# EasyEDA Pro project ProPrj_信号发生器_2025-05-10.epro

# Schematic Schematic1
Board Name: Board1; Create Date: 2025-05-10; Page Name: P1; Project Name: 信号发生器; Schematic Name: Schematic1; Update Date: 2025-05-10; Company: 嘉立创EDA; Page Size: A3; Version: V1.0
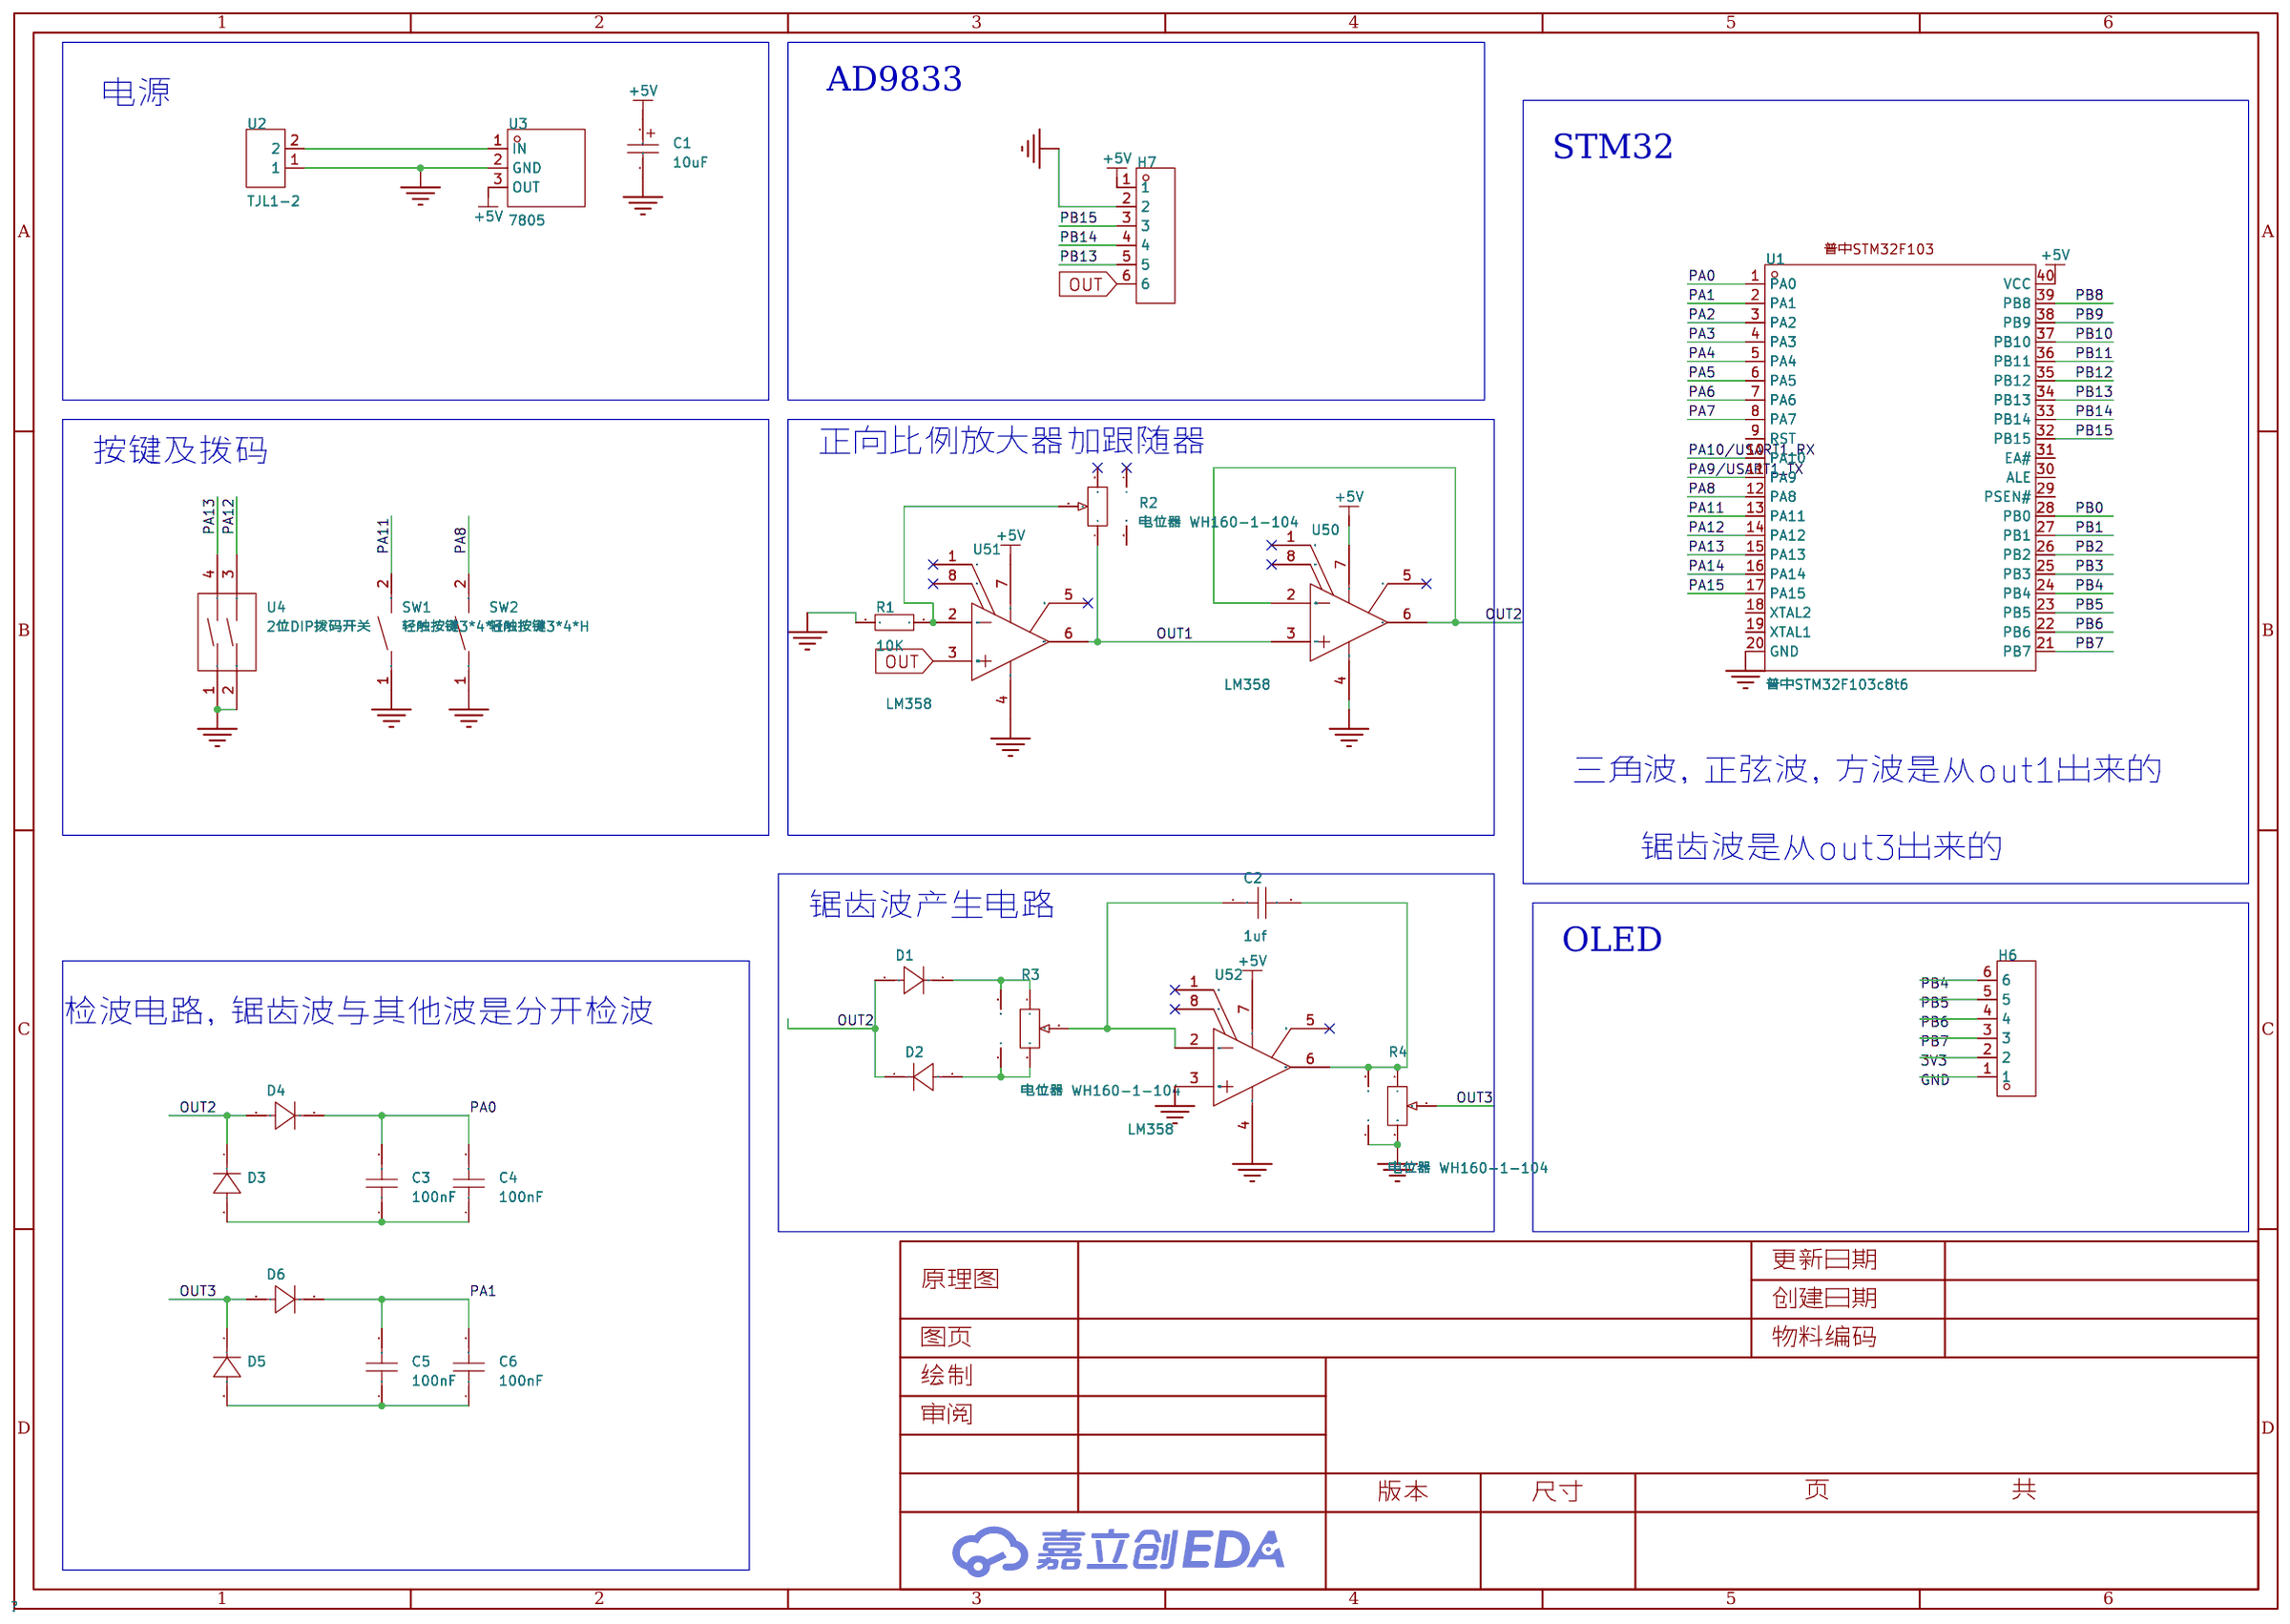
[diagram p0: schematic sheet]

## Parts
C1  10uF  [C_Ele_SMD_3x5.4mm]
C2  1uf  [C0603]
C3  100nF  [C0603]
C4  100nF  [C0603]
C5  100nF  [C0603]
C6  100nF  [C0603]
D1  -  [DO_1N4007]
D2  -  [DO_1N4007]
D3  -  [DO_1N4007]
D4  -  [DO_1N4007]
D5  -  [DO_1N4007]
D6  -  [DO_1N4007]
H6  -  [HDR-TH_6P-P2.54-V-F]
H7  -  [HDR-TH_6P-P2.54-V-F]
R1  10K  [R0603]
R2  电位器 WH160-1-104  [RES-TH_WH160-1-104]
R3  电位器 WH160-1-104  [RES-TH_WH160-1-104]
R4  电位器 WH160-1-104  [RES-TH_WH160-1-104]
SW1  轻触按键3*4*H  [SW-SMD_L4.0-W2.9-LS5.0]
SW2  轻触按键3*4*H  [SW-SMD_L4.0-W2.9-LS5.0]
U1  普中STM32F103c8t6  [DIP-40_L52.0-W13.7-P2.54-LS15.2-BL]
U2  TJL1-2  [CONN-TH_2P-P3.96_TJL1-2]
U3  7805  [TO-220-3_L10.2-W4.5-P2.54-L-1]
U4  2位DIP拨码开关  [SW-TH_4P-L9.9-W6.8-P7.62-BL]
U50  LM358  [SOIC-8_L4.9-W3.9-P1.27-LS6.0-BL]
U51  LM358  [SOIC-8_L4.9-W3.9-P1.27-LS6.0-BL]
U52  LM358  [SOIC-8_L4.9-W3.9-P1.27-LS6.0-BL]

## Library data of the parts
C1 = C_Ele_SMD_3x5.4mm: Supplier Footprint: SMD,3x5.4mm
C2-C6 = CAP_0603: Supplier Footprint: 0603
D1-D6 = D_1N4007A: Supplier Footprint: DO-41
H6 H7 = HDR-F_2.54_1x6P: Supplier Part: C40877; Supplier Footprint: 插件
R1 = Res_0603: Supplier Footprint: 0603
R2-R4 = 电位器 WH160-1-104: Supplier Part: C61836; Supplier Footprint: 插件,3P16mm; JLCPCB Part Class: 扩展库; Supplier: LCSC
SW1 SW2 = 轻触按键3*4*H: Supplier Part: C9900017573; Supplier Footprint: 轻触按键3*4*2.5; JLCPCB Part Class: 扩展库; Supplier: LCSC
U1 = STC89C52RC-40I-PDIP40: CPU内核:51系列;CPU最大主频:-;工作电压范围:3.3V~5.5V;内部振荡器:-;外部时钟频率范围:-;程序 FLASH容量:8KB;RAM总容量:512Byte;EEPROM/数据 FLASH容量:4KB;GPIO端口数量:35;ADC(单元数/通道数/位数):-;DAC(单元数/通道数/位数):-;(E)PWM(单元数/通道数/位数):-;8位Timer数量:-;16位Timer数量:3;32位Timer数量:-;内部比较器数量:-;U(S)ART路数:1;I2C路数:-;I2S路数:-;(; LCSC Part Name: 51系列 闪存：8KB RAM：512Byte; Supplier Part: C14022; Manufacturer: STC(宏晶); Supplier Footprint: DIP-40; JLCPCB Part Class: 扩展库; Datasheet: https://atta.szlcsc.com/upload/public/pdf/source/20210104/C14022_3E6032FDBB5DBC6F971AD019A8472F5B.pdf; Supplier: LCSC; CPU Core: 51系列; Supply Voltage Range: 3.3V~5.5V; Program FLASH Size: 8KB; RAM Size: 512Byte; EEPROM/Data FLASH Size: 4KB; GPIO Ports Number: 35; 16Bit Timer Number: 3; U(S)ART Number: 1; Peripherals / Functions / Protocol Stacks: 看门狗; Operating Temperature Range: -40℃~+85℃
U2 = TJL1-2: Supplier Part: C9900015136; Supplier Footprint: 3.96-2P直插端子; JLCPCB Part Class: 扩展库; Supplier: LCSC
U3 = 7805: 输出类型:固定;最大输入电压:35V;输出电压:5V;最大输出电流:1.5A;电源纹波抑制比(PSRR):62dB@(120Hz);输出极性:正极;; LCSC Part Name: 输入35V 输出5V 1.5A; Supplier Part: C4944936; Manufacturer: SY(顺烨); Supplier Footprint: TO-220AB; JLCPCB Part Class: 扩展库; Datasheet: https://atta.szlcsc.com/upload/public/pdf/source/20220719/323A3F14557C229271C454C7C0F759A5.pdf; Supplier: LCSC; Output Type: 固定; Maximum Input Voltage: 35V; Output Voltage: 5V; MAX Output Current: 1.5A; Power Supply Rejection Ratio (PSRR): 62dB@(120Hz); Output Polarity: 正极
U4 = 2位DIP拨码开关: Supplier Part: C9900014698; Supplier Footprint: CSWDIP-2P; JLCPCB Part Class: 扩展库; Supplier: LCSC
U50-U52 = OPA690IDG4: 具有禁用功能的宽带电压反馈运算放大器 8-SOIC -40 to 85; Supplier Part: C1348107; Manufacturer: TI(德州仪器); Supplier Footprint: SOIC-8; JLCPCB Part Class: 扩展库; Datasheet: https://atta.szlcsc.com/upload/public/pdf/source/20230222/B73FAAE63D6AF4DE8C24EE8147F1A2AC.pdf; Supplier: LCSC

## Nets
3V3: H6.2
+5V: C1.1 H7.1 U1.40(VCC) U3.3(OUT) U50.7(+VS) U51.7(+VS) U52.7(+VS)
GND: C1.2 H6.1 H7.2 R1.1 R4.3 R4.4 SW1.1 SW2.1 U1.20(GND) U2.1 U3.2(GND) U4.1 U4.2 U50.4(-VS) U51.4(-VS) U52.3(Noninverting Input) U52.4(-VS)
OUT: H7.6 U51.3(Noninverting Input)
OUT1: R2.1 U50.3(Noninverting Input) U51.6(Output)
OUT2: D1.2(A) D2.1(K) D3.1(K) D4.2(A) U50.2(Inverting Input) U50.6(Output)
OUT3: D5.1(K) D6.2(A) R4.2
PA0: C3.2 C4.2 D4.1(K) U1.1(PA0)
PA1: C5.2 C6.2 D6.1(K) U1.2(PA1)
PA2: U1.3(PA2)
PA3: U1.4(PA3)
PA4: U1.5(PA4)
PA5: U1.6(PA5)
PA6: U1.7(PA6)
PA7: U1.8(PA7)
PA8: SW2.2 U1.12(PA8)
PA9/USART1_TX: U1.11(PA9)
PA10/USART1_RX: U1.10(PA10)
PA11: SW1.2 U1.13(PA11)
PA12: U1.14(PA12) U4.3
PA13: U1.15(PA13) U4.4
PA14: U1.16(PA14)
PA15: U1.17(PA15)
PB0: U1.28(PB0)
PB1: U1.27(PB1)
PB2: U1.26(PB2)
PB3: U1.25(PB3)
PB4: H6.6 U1.24(PB4)
PB5: H6.5 U1.23(PB5)
PB6: H6.4 U1.22(PB6)
PB7: H6.3 U1.21(PB7)
PB8: U1.39(PB8)
PB9: U1.38(PB9)
PB10: U1.37(PB10)
PB11: U1.36(PB11)
PB12: U1.35(PB12)
PB13: H7.5 U1.34(PB13)
PB14: H7.4 U1.33(PB14)
PB15: H7.3 U1.32(PB15)
Net-(C2-1): C2.1 R3.2 U52.2(Inverting Input)
Net-(C2-2): C2.2 R4.1 R4.5 U52.6(Output)
Net-(C3-1): C3.1 C4.1 D3.2(A)
Net-(C5-1): C5.1 C6.1 D5.2(A)
Net-(D1-1): D1.1(K) R3.1 R3.5
Net-(D2-2): D2.2(A) R3.3 R3.4
Net-(R1-2): R1.2 R2.2 U51.2(Inverting Input)
Net-(U2-2): U2.2 U3.1(IN)

Not connected (* = marked no-connect by the designer): R2 3* 4* 5; U1 9(RST) 18(XTAL2) 19(XTAL1) 29(PSEN#) 30(ALE) 31(EA#); U50 1(NC)* 5(NC)* 8(DIS#)*; U51 1(NC)* 5(NC)* 8(DIS#)*; U52 1(NC)* 5(NC)* 8(DIS#)*

## Notes on the sheet
- 电源
- AD9833
- STM32
- 正向比例放大器加跟随器
- 按键及拨码
- 三角波，正弦波，方波是从out1出来的
- 锯齿波是从out3出来的
- 锯齿波产生电路
- OLED
- 检波电路，锯齿波与其他波是分开检波
